# Altium schematic sheet Active_N_branch.SchDoc
size A4; SheetNumber: 3; SheetTotal: 6
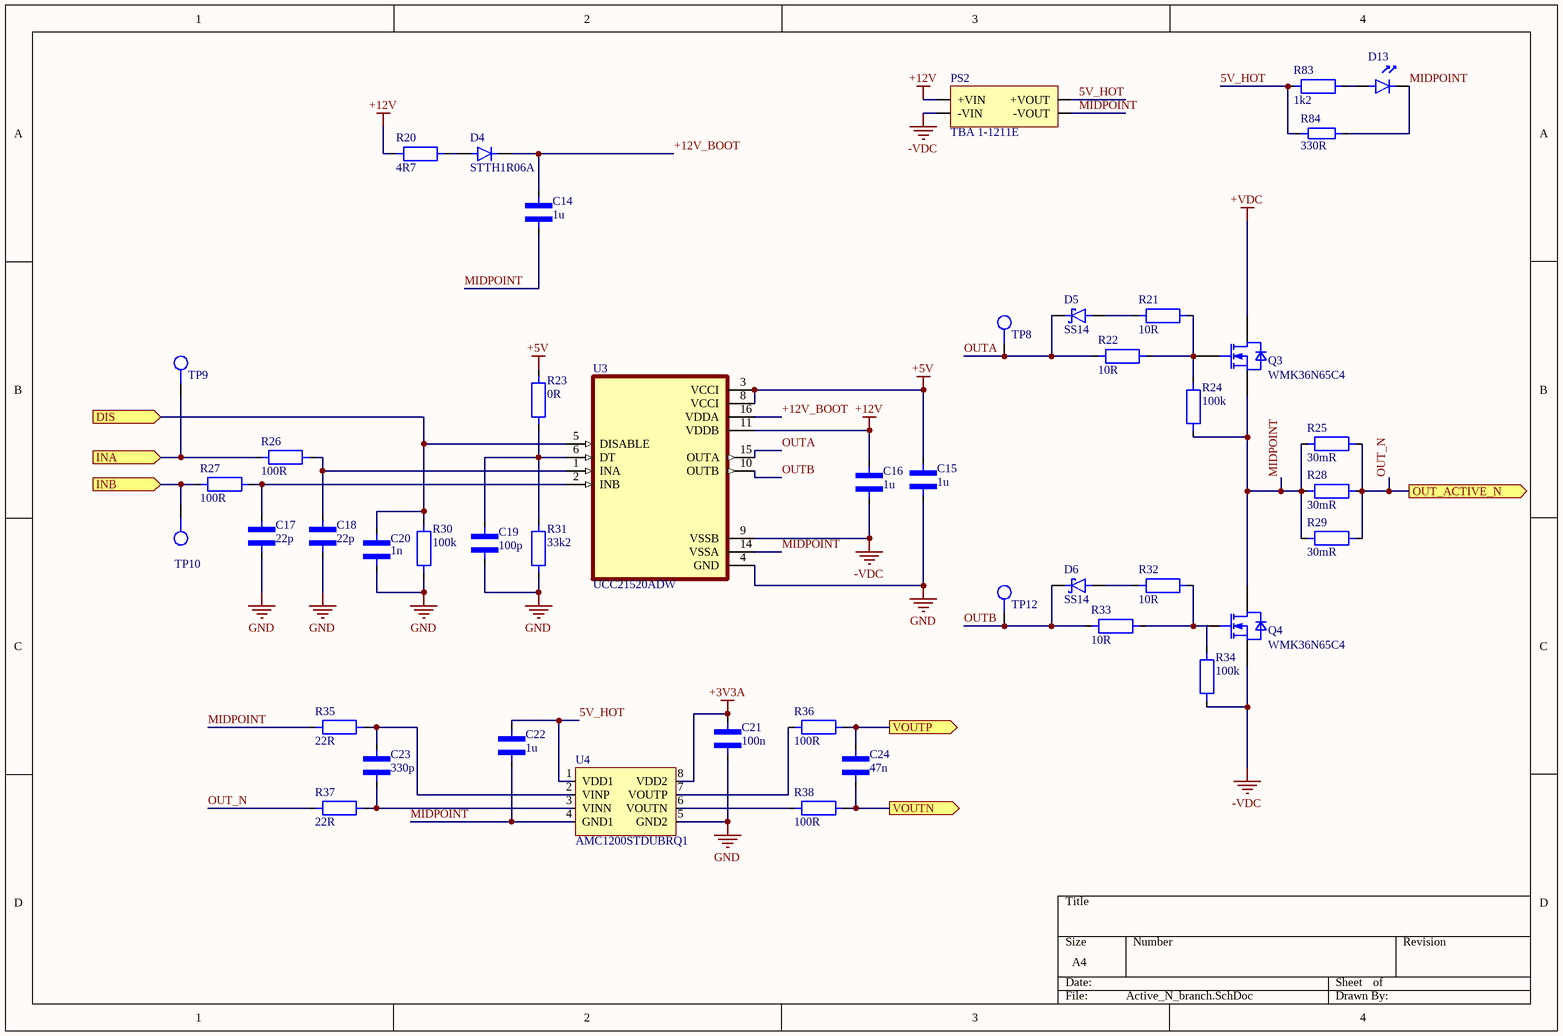
[diagram p0: Active_N_branch.SchDoc]

## Parts
C14  1u  [CAPACITOR_1206]
C15  1u  [Capacitor_0805]
C16  1u  [Capacitor_0805]
C17  22p  [Capacitor_0805]
C18  22p  [Capacitor_0805]
C19  100p  [Capacitor_0805]
C20  1n  [Capacitor_0805]
C21  100n  [Capacitor_0805]
C22  1u  [Capacitor_0805]
C23  330p  [Capacitor_0805]
C24  47n  [Capacitor_0805]
D4  STTH1R06A  [STTH1R06A]
D5  SS14  [DIOM5226X230N]
D6  SS14  [DIOM5226X230N]
D13  LTST-C171KRKT  [LTST-C171K]  (value not drawn)
PS2  TBA 1-1211E  [TBA 1-1211E]
Q3  WMK36N65C4  [TO220-3]
Q4  WMK36N65C4  [TO220-3]
R20  4R7  [RESISTOR_1206]
R21  10R  [RESISTOR_0805]
R22  10R  [RESISTOR_0805]
R23  0R  [RESISTOR_0805]
R24  100k  [RESISTOR_0805]
R25  30mR  [MAR251203FR030S]
R26  100R  [RESISTOR_0805]
R27  100R  [RESISTOR_0805]
R28  30mR  [MAR251203FR030S]
R29  30mR  [MAR251203FR030S]
R30  100k  [RESISTOR_0805]
R31  33k2  [RESISTOR_0805]
R32  10R  [RESISTOR_0805]
R33  10R  [RESISTOR_0805]
R34  100k  [RESISTOR_0805]
R35  22R  [RESISTOR_0805]
R36  100R  [RESISTOR_0805]
R37  22R  [RESISTOR_0805]
R38  100R  [RESISTOR_0805]
R83  1k2  [RESISTOR_0805]
R84  330R  [RESISTOR_1206]
TP8  TestPoint  [TestPoint_1.5mm]  (value not drawn)
TP9  TestPoint  [TestPoint_1.5mm]  (value not drawn)
TP10  TestPoint  [TestPoint_1.5mm]  (value not drawn)
TP12  TestPoint  [TestPoint_1.5mm]  (value not drawn)
U3  UCC21520ADW  [UCC21520ADW]
U4  AMC1200STDUBRQ1  [SOP254P1040X485-8N]

## Ports
DIS (in), INA (in), INB (in), OUT_ACTIVE_N (out), VOUTN (out), VOUTP (out)

## Nets
+3V3A: C21.2 U4.8(VDD2)
+5V: C15.1 R23.2 U3.3(VCCI) U3.8(VCCI)
+12V: C16.2 PS2.1(+VIN) R20.1 U3.11(VDDB)
+VDC: Q3.2(DRAIN)
-VDC: C16.1 PS2.2(-VIN) Q4.3(SOURCE) R34.1 U3.9(VSSB)
GND: C15.2 C17.1 C18.1 C19.1 C20.1 C21.1 R30.1 R31.1 U3.4(GND) U4.5(GND2)
5V_HOT: C22.2 PS2.4(+VOUT) R83.1 R84.1 U4.1(VDD1)
+12V_BOOT: C14.1 D4.2(K) U3.16(VDDA)
DIS: C20.2 R30.2 U3.5(DISABLE) ; port DIS
INA: R26.1 TP9.1 ; port INA
INB: R27.1 TP10.1 ; port INB
MIDPOINT: C14.2 C22.1 D13.2(K) PS2.3(-VOUT) Q3.3(SOURCE) Q4.2(DRAIN) R24.1 R25.1 R28.1 R29.1 R35.1 R84.2 U3.14(VSSA) U4.4(GND1)
OUT_N: R25.2 R28.2 R29.2 R37.1 ; port OUT_ACTIVE_N
OUTA: D5.2(K) R22.1 TP8.1 U3.15(OUTA)
OUTB: D6.2(K) R33.1 TP12.1 U3.10(OUTB)
VOUTN: C24.1 R38.2 ; port VOUTN
VOUTP: C24.2 R36.2 ; port VOUTP
NetC17_2: C17.2 R27.2 U3.2(INB)
NetC18_2: C18.2 R26.2 U3.1(INA)
NetC19_2: C19.2 R23.1 R31.2 U3.6(DT)
NetC23_1: C23.1 R37.2 U4.3(VINN)
NetC23_2: C23.2 R35.2 U4.2(VINP)
NetD4_1: D4.1(A) R20.2
NetD5_1: D5.1(A) R21.1
NetD6_1: D6.1(A) R32.1
NetD13_1: D13.1(A) R83.2
NetQ3_1: Q3.1(GATE) R21.2 R22.2 R24.2
NetQ4_1: Q4.1(GATE) R32.2 R33.2 R34.2
NetR36_1: R36.1 U4.7(VOUTP)
NetR38_1: R38.1 U4.6(VOUTN)

## Library data of the parts
C14 = CAPACITOR_1206: MLCC capacitor in 1206 package
C15-C24 = CAPACITOR_0805: MLCC capacitor in 0805 package
D4 = STTH1R06A: Diode: rectifying; SMD; 600V; 1A; 25ns; SMA; Ufmax: 1V; Ifsm: 20A
D5 D6 = SS14: 1A, 40V, Schottky Rectifier; MF: Taiwan Semiconductor; SnapEDA_Link: https://www.snapeda.com/parts/SS14/taiwan/view-part/?ref=snap; Package: SMA-2 Taiwan Semiconductor; MP: SS14; Check_prices: https://www.snapeda.com/parts/SS14/taiwan/view-part/?ref=eda
D13 = LTST-C171KRKT: LED; red; SMD; 0805; 18÷54mcd; 2÷2.4VDC; 2x1.25x0.8mm; 130°; 20mA
PS2 = TBA 1-1211E: Converter: DC/DC; 1W; Uin: 10.8÷13.2VDC; Uout: 5VDC; Iout: 200mA; pin to pad: 3>4 4>6
Q3 Q4 = WMK36N65C4: Transistor: N-MOSFET; WMOS™ C4; unipolar; 650V; 20A; Idm: 100A; 277W; Manufacturer: WAYON; ManufacturerPartNumber: WMK36N65C4; PackageReference: PG-TO220
R20 R84 = RESISTOR_1206: SMD resistor in 1206 package
R21-R24 R26 R27 R32-R38 R83 = RESISTOR_0805: SMD resistor in 0805 package
  R26: Value: 100R
R25 R28 R29 = MAR251203FR030S: Resistor: thick film; 30mΩ; sensing; SMD; 2512; 3W; ±1%; -55÷170°C; Manufacturer: Wayon; Value: 30mR; ComponentLink1Description: TME; ComponentLink1URL: https://www.tme.eu/pl/details/mar251203fr010s/rezystory-smd/wayon/; Power: 3W; Tolerance: 1%
R30 R31 = RESISTOR_0805: SMD resistor in 0805 package; Value: 100R
U3 = UCC21520ADW: 5.7kVrms, 4A/6A dual-channel isolated gate driver w/ dual input, disable pin, 8V UVLO in DW package; MF: Texas Instruments; SnapEDA_Link: https://www.snapeda.com/parts/UCC21520ADW/Texas+Instruments/view-part/?ref=snap; Package: SOIC-16 Texas Instruments; Value: *; MP: UCC21520ADW; Check_prices: https://www.snapeda.com/parts/UCC21520ADW/Texas+Instruments/view-part/?ref=eda
U4 = AMC1200: AMC1200/B Fully-Differential Isolation Amplifier; Manufacturer: Texas Instruments